# Altium schematic sheet PEG_PCIEX1 SLOT.schdoc
size 420 x 298 mm; Symbol: Sheet-Symbol_A3; Company: 嘉立创EDA; Version: V1.0; Page Size: A3; @Project Name: 【全网首发】X86电脑主板_copy; @Page Count: 17; @Update Date: 2025-10-09; @Create Date: 2025-10-09; @Schematic Name: SCHEMATIC1_1; @Page No: 0; @Page Name: PEG/PCIEX1 SLOT; Device: Sheet-Symbol_A3
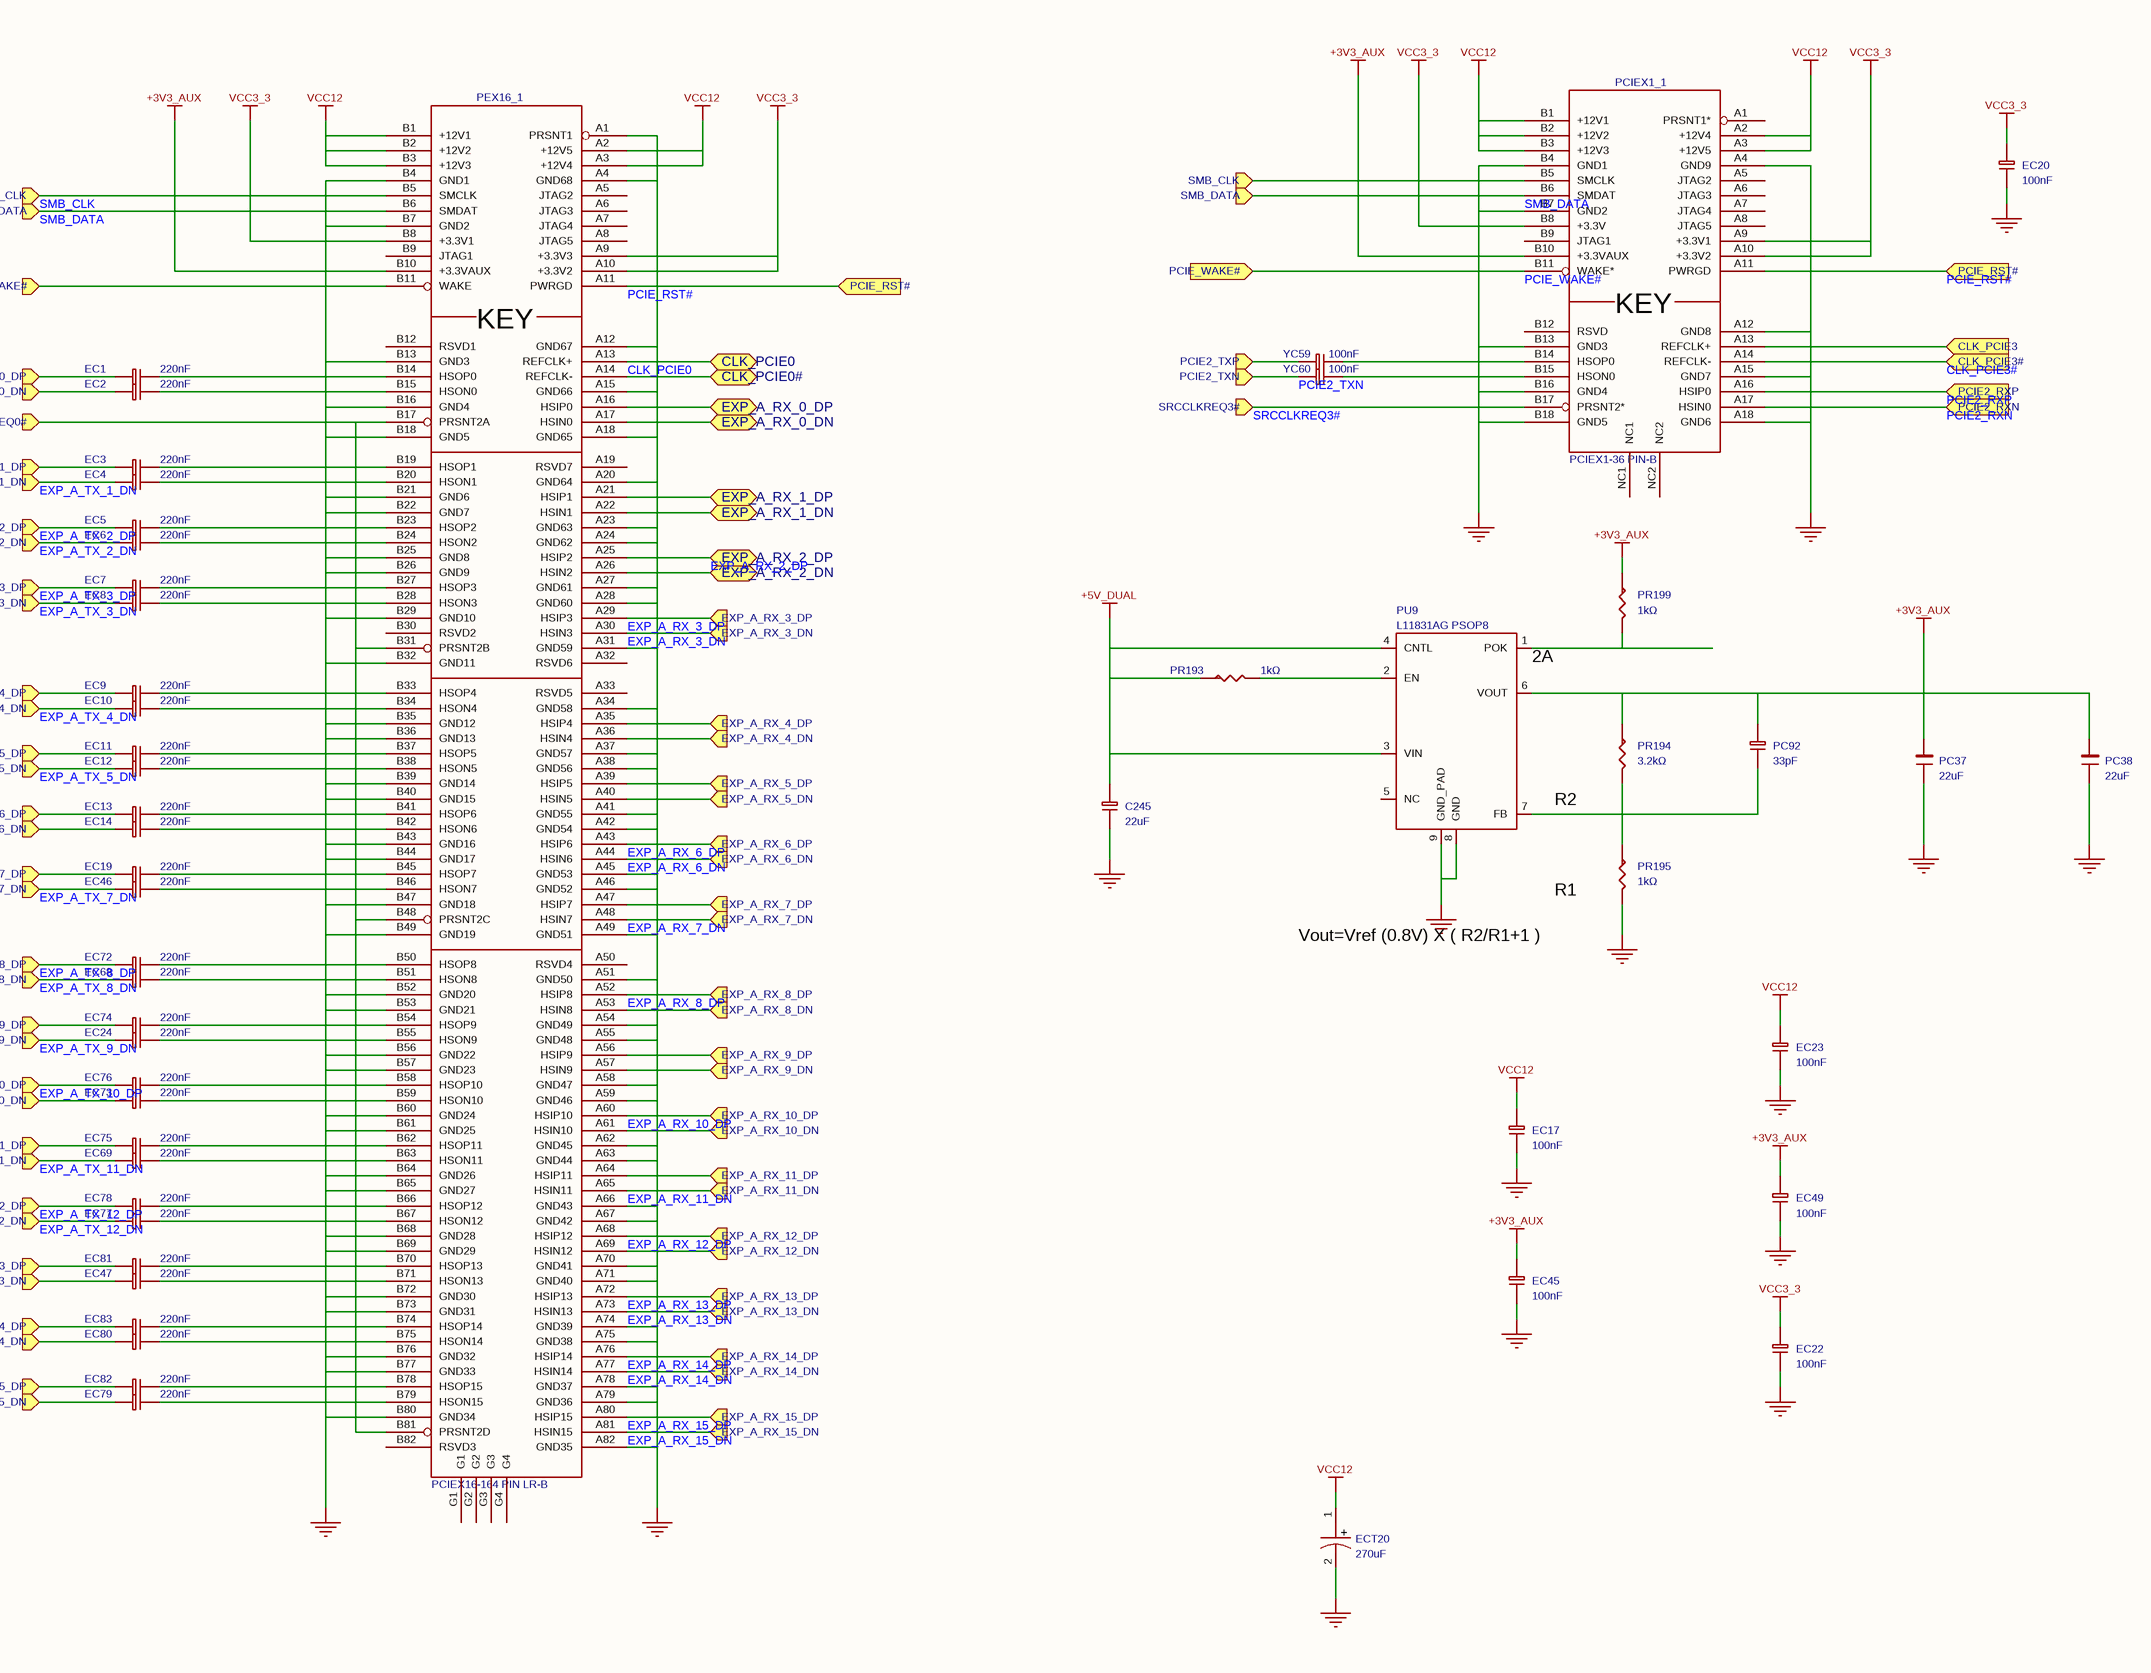
[diagram p0: PEG_PCIEX1 SLOT.schdoc]

## Parts
C245  22uF  [C0603_2]
EC1  220nF  [C0402_1]
EC2  220nF  [C0402_1]
EC3  220nF  [C0402_1]
EC4  220nF  [C0402_1]
EC5  220nF  [C0402_1]
EC6  220nF  [C0402_1]
EC7  220nF  [C0402_1]
EC8  220nF  [C0402_1]
EC9  220nF  [C0402_1]
EC10  220nF  [C0402_1]
EC11  220nF  [C0402_1]
EC12  220nF  [C0402_1]
EC13  220nF  [C0402_1]
EC14  220nF  [C0402_1]
EC17  100nF  [C0402_1]
EC19  220nF  [C0402_1]
EC20  100nF  [C0402_1]
EC22  100nF  [C0402_1]
EC23  100nF  [C0402_3]
EC24  220nF  [C0402_1]
EC45  100nF  [C0402_1]
EC46  220nF  [C0402_1]
EC47  220nF  [C0402_1]
EC49  100nF  [C0402_1]
EC68  220nF  [C0402_1]
EC69  220nF  [C0402_1]
EC72  220nF  [C0402_1]
EC73  220nF  [C0402_1]
EC74  220nF  [C0402_1]
EC75  220nF  [C0402_1]
EC76  220nF  [C0402_1]
EC77  220nF  [C0402_1]
EC78  220nF  [C0402_1]
EC79  220nF  [C0402_1]
EC80  220nF  [C0402_1]
EC81  220nF  [C0402_1]
EC82  220nF  [C0402_1]
EC83  220nF  [C0402_1]
ECT20  270uF  [EC1P25C_2]
PC37  22uF  [C0603_3]
PC38  22uF  [C0603_3]
PC92  33pF  [C0402_3]
PCIEX1_1  value PCIEX1-36 PIN-B  [3GIO_X1-20060619]  (hidden comment: 3183-10200P1T)
PEX16_1  value PCIEX16-164 PIN LR-B  [3GIO_X16_AIR_KORTAK_AKL]  (hidden comment: 2EG78227-D2DL-4F)
PR193  1kΩ  [R0402]
PR194  3.2kΩ  [R0402_3]
PR195  1kΩ  [R0402_2]
PR199  1kΩ  [R0402_2]
PU9  value L11831AG PSOP8  [SO8_50_150GV_2]  (hidden comment: RT9173B_0)
YC59  100nF  [C0402_3]
YC60  100nF  [C0402_3]

## Ports
CLK_PCIE0 (bidir), CLK_PCIE0# (bidir), CLK_PCIE3 (in), CLK_PCIE3# (in), EXP_A_RX_0_DN (bidir), EXP_A_RX_0_DP (bidir), EXP_A_RX_1_DN (bidir), EXP_A_RX_1_DP (bidir), EXP_A_RX_2_DN (bidir), EXP_A_RX_2_DP (bidir), EXP_A_RX_3_DN (in), EXP_A_RX_3_DP (in), EXP_A_RX_4_DN (in), EXP_A_RX_4_DP (in), EXP_A_RX_5_DN (in), EXP_A_RX_5_DP (in), EXP_A_RX_6_DN (in), EXP_A_RX_6_DP (in), EXP_A_RX_7_DN (in), EXP_A_RX_7_DP (in), EXP_A_RX_8_DN (in), EXP_A_RX_8_DP (in), EXP_A_RX_9_DN (in), EXP_A_RX_9_DP (in), EXP_A_RX_10_DN (in), EXP_A_RX_10_DP (in), EXP_A_RX_11_DN (in), EXP_A_RX_11_DP (in), EXP_A_RX_12_DN (in), EXP_A_RX_12_DP (in), EXP_A_RX_13_DN (in), EXP_A_RX_13_DP (in), EXP_A_RX_14_DN (in), EXP_A_RX_14_DP (in), EXP_A_RX_15_DN (in), EXP_A_RX_15_DP (in), EXP_A_TX_0_DN (in), EXP_A_TX_0_DP (in), EXP_A_TX_1_DN (in), EXP_A_TX_1_DP (in), EXP_A_TX_2_DN (in), EXP_A_TX_2_DP (in), EXP_A_TX_3_DN (in), EXP_A_TX_3_DP (in), EXP_A_TX_4_DN (in), EXP_A_TX_4_DP (in), EXP_A_TX_5_DN (in), EXP_A_TX_5_DP (in), EXP_A_TX_6_DN (in), EXP_A_TX_6_DP (in), EXP_A_TX_7_DN (in), EXP_A_TX_7_DP (in), EXP_A_TX_8_DN (in), EXP_A_TX_8_DP (in), EXP_A_TX_9_DN (in), EXP_A_TX_9_DP (in), EXP_A_TX_10_DN (in), EXP_A_TX_10_DP (in), EXP_A_TX_11_DN (in), EXP_A_TX_11_DP (in), EXP_A_TX_12_DN (in), EXP_A_TX_12_DP (in), EXP_A_TX_13_DN (in), EXP_A_TX_13_DP (in), EXP_A_TX_14_DN (in), EXP_A_TX_14_DP (in), EXP_A_TX_15_DN (in), EXP_A_TX_15_DP (in), PCIE2_RXN (in), PCIE2_RXP (in), PCIE2_TXN (in), PCIE2_TXP (in), PCIE_RST# (in), PCIE_WAKE# (in), SMB_CLK (in), SMB_DATA (in), SRCCLKREQ0# (in), SRCCLKREQ3# (in)

## Nets
+3V3_AUX: EC45.1 EC49.1 PC37.1 PC38.1 PC92.2 PCIEX1_1.B10(+3.3VAUX) PEX16_1.B10(+3.3VAUX) PR194.1 PR199.1 PU9.6(VOUT)
+5V_DUAL: C245.1 PR193.1 PU9.3(VIN) PU9.4(CNTL)
GND: C245.2 EC17.2 EC20.2 EC22.2 EC23.2 EC45.2 EC49.2 ECT20.2 PC37.2 PC38.2 PCIEX1_1.A4(GND9) PCIEX1_1.A12(GND8) PCIEX1_1.A15(GND7) PCIEX1_1.A18(GND6) PCIEX1_1.B4(GND1) PCIEX1_1.B7(GND2) PCIEX1_1.B13(GND3) PCIEX1_1.B16(GND4) PCIEX1_1.B18(GND5) PEX16_1.A1(PRSNT1) PEX16_1.A4(GND68) PEX16_1.A12(GND67) PEX16_1.A15(GND66) PEX16_1.A18(GND65) PEX16_1.A20(GND64) PEX16_1.A23(GND63) PEX16_1.A24(GND62) PEX16_1.A27(GND61) PEX16_1.A28(GND60) PEX16_1.A31(GND59) PEX16_1.A34(GND58) PEX16_1.A37(GND57) PEX16_1.A38(GND56) PEX16_1.A41(GND55) PEX16_1.A42(GND54) PEX16_1.A45(GND53) PEX16_1.A46(GND52) PEX16_1.A49(GND51) PEX16_1.A51(GND50) PEX16_1.A54(GND49) PEX16_1.A55(GND48) PEX16_1.A58(GND47) PEX16_1.A59(GND46) PEX16_1.A62(GND45) PEX16_1.A63(GND44) PEX16_1.A66(GND43) PEX16_1.A67(GND42) PEX16_1.A70(GND41) PEX16_1.A71(GND40) PEX16_1.A74(GND39) PEX16_1.A75(GND38) PEX16_1.A78(GND37) PEX16_1.A79(GND36) PEX16_1.A82(GND35) PEX16_1.B4(GND1) PEX16_1.B7(GND2) PEX16_1.B13(GND3) PEX16_1.B16(GND4) PEX16_1.B18(GND5) PEX16_1.B21(GND6) PEX16_1.B22(GND7) PEX16_1.B25(GND8) PEX16_1.B26(GND9) PEX16_1.B29(GND10) PEX16_1.B32(GND11) PEX16_1.B35(GND12) PEX16_1.B36(GND13) PEX16_1.B39(GND14) PEX16_1.B40(GND15) PEX16_1.B43(GND16) PEX16_1.B44(GND17) PEX16_1.B47(GND18) PEX16_1.B49(GND19) PEX16_1.B52(GND20) PEX16_1.B53(GND21) PEX16_1.B56(GND22) PEX16_1.B57(GND23) PEX16_1.B60(GND24) PEX16_1.B61(GND25) PEX16_1.B64(GND26) PEX16_1.B65(GND27) PEX16_1.B68(GND28) PEX16_1.B69(GND29) PEX16_1.B72(GND30) PEX16_1.B73(GND31) PEX16_1.B76(GND32) PEX16_1.B77(GND33) PEX16_1.B80(GND34) PR195.2 PU9.8(GND) PU9.9(GND_PAD)
VCC3_3: EC20.1 EC22.1 PCIEX1_1.A9(+3.3V1) PCIEX1_1.A10(+3.3V2) PCIEX1_1.B8(+3.3V) PEX16_1.A9(+3.3V3) PEX16_1.A10(+3.3V2) PEX16_1.B8(+3.3V1)
VCC12: EC17.1 EC23.1 ECT20.1 PCIEX1_1.A2(+12V4) PCIEX1_1.A3(+12V5) PCIEX1_1.B1(+12V1) PCIEX1_1.B2(+12V2) PCIEX1_1.B3(+12V3) PEX16_1.A2(+12V5) PEX16_1.A3(+12V4) PEX16_1.B1(+12V1) PEX16_1.B2(+12V2) PEX16_1.B3(+12V3)
CLK_PCIE0: PEX16_1.A13(REFCLK+) ; port CLK_PCIE0
CLK_PCIE0#: PEX16_1.A14(REFCLK-) ; port CLK_PCIE0#
CLK_PCIE3: PCIEX1_1.A13(REFCLK+) ; port CLK_PCIE3
CLK_PCIE3#: PCIEX1_1.A14(REFCLK-) ; port CLK_PCIE3#
EXP_A_RX_0_DN: PEX16_1.A17(HSIN0) ; port EXP_A_RX_0_DN
EXP_A_RX_0_DP: PEX16_1.A16(HSIP0) ; port EXP_A_RX_0_DP
EXP_A_RX_1_DN: PEX16_1.A22(HSIN1) ; port EXP_A_RX_1_DN
EXP_A_RX_1_DP: PEX16_1.A21(HSIP1) ; port EXP_A_RX_1_DP
EXP_A_RX_2_DN: PEX16_1.A26(HSIN2) ; port EXP_A_RX_2_DN
EXP_A_RX_2_DP: PEX16_1.A25(HSIP2) ; port EXP_A_RX_2_DP
EXP_A_RX_3_DN: PEX16_1.A30(HSIN3) ; port EXP_A_RX_3_DN
EXP_A_RX_3_DP: PEX16_1.A29(HSIP3) ; port EXP_A_RX_3_DP
EXP_A_RX_4_DN: PEX16_1.A36(HSIN4) ; port EXP_A_RX_4_DN
EXP_A_RX_4_DP: PEX16_1.A35(HSIP4) ; port EXP_A_RX_4_DP
EXP_A_RX_5_DN: PEX16_1.A40(HSIN5) ; port EXP_A_RX_5_DN
EXP_A_RX_5_DP: PEX16_1.A39(HSIP5) ; port EXP_A_RX_5_DP
EXP_A_RX_6_DN: PEX16_1.A44(HSIN6) ; port EXP_A_RX_6_DN
EXP_A_RX_6_DP: PEX16_1.A43(HSIP6) ; port EXP_A_RX_6_DP
EXP_A_RX_7_DN: PEX16_1.A48(HSIN7) ; port EXP_A_RX_7_DN
EXP_A_RX_7_DP: PEX16_1.A47(HSIP7) ; port EXP_A_RX_7_DP
EXP_A_RX_8_DN: PEX16_1.A53(HSIN8) ; port EXP_A_RX_8_DN
EXP_A_RX_8_DP: PEX16_1.A52(HSIP8) ; port EXP_A_RX_8_DP
EXP_A_RX_9_DN: PEX16_1.A57(HSIN9) ; port EXP_A_RX_9_DN
EXP_A_RX_9_DP: PEX16_1.A56(HSIP9) ; port EXP_A_RX_9_DP
EXP_A_RX_10_DN: PEX16_1.A61(HSIN10) ; port EXP_A_RX_10_DN
EXP_A_RX_10_DP: PEX16_1.A60(HSIP10) ; port EXP_A_RX_10_DP
EXP_A_RX_11_DN: PEX16_1.A65(HSIN11) ; port EXP_A_RX_11_DN
EXP_A_RX_11_DP: PEX16_1.A64(HSIP11) ; port EXP_A_RX_11_DP
EXP_A_RX_12_DN: PEX16_1.A69(HSIN12) ; port EXP_A_RX_12_DN
EXP_A_RX_12_DP: PEX16_1.A68(HSIP12) ; port EXP_A_RX_12_DP
EXP_A_RX_13_DN: PEX16_1.A73(HSIN13) ; port EXP_A_RX_13_DN
EXP_A_RX_13_DP: PEX16_1.A72(HSIP13) ; port EXP_A_RX_13_DP
EXP_A_RX_14_DN: PEX16_1.A77(HSIN14) ; port EXP_A_RX_14_DN
EXP_A_RX_14_DP: PEX16_1.A76(HSIP14) ; port EXP_A_RX_14_DP
EXP_A_RX_15_DN: PEX16_1.A81(HSIN15) ; port EXP_A_RX_15_DN
EXP_A_RX_15_DP: PEX16_1.A80(HSIP15) ; port EXP_A_RX_15_DP
EXP_A_TX_0_DN: EC2.1 ; port EXP_A_TX_0_DN
EXP_A_TX_0_DP: EC1.1 ; port EXP_A_TX_0_DP
EXP_A_TX_1_DN: EC4.1 ; port EXP_A_TX_1_DN
EXP_A_TX_1_DP: EC3.1 ; port EXP_A_TX_1_DP
EXP_A_TX_2_DN: EC6.1 ; port EXP_A_TX_2_DN
EXP_A_TX_2_DP: EC5.1 ; port EXP_A_TX_2_DP
EXP_A_TX_3_DN: EC8.1 ; port EXP_A_TX_3_DN
EXP_A_TX_3_DP: EC7.1 ; port EXP_A_TX_3_DP
EXP_A_TX_4_DN: EC10.1 ; port EXP_A_TX_4_DN
EXP_A_TX_4_DP: EC9.1 ; port EXP_A_TX_4_DP
EXP_A_TX_5_DN: EC12.1 ; port EXP_A_TX_5_DN
EXP_A_TX_5_DP: EC11.1 ; port EXP_A_TX_5_DP
EXP_A_TX_6_DN: EC14.1 ; port EXP_A_TX_6_DN
EXP_A_TX_6_DP: EC13.1 ; port EXP_A_TX_6_DP
EXP_A_TX_7_DN: EC46.1 ; port EXP_A_TX_7_DN
EXP_A_TX_7_DP: EC19.1 ; port EXP_A_TX_7_DP
EXP_A_TX_8_DN: EC68.1 ; port EXP_A_TX_8_DN
EXP_A_TX_8_DP: EC72.1 ; port EXP_A_TX_8_DP
EXP_A_TX_9_DN: EC24.1 ; port EXP_A_TX_9_DN
EXP_A_TX_9_DP: EC74.1 ; port EXP_A_TX_9_DP
EXP_A_TX_10_DN: EC73.1 ; port EXP_A_TX_10_DN
EXP_A_TX_10_DP: EC76.1 ; port EXP_A_TX_10_DP
EXP_A_TX_11_DN: EC69.1 ; port EXP_A_TX_11_DN
EXP_A_TX_11_DP: EC75.1 ; port EXP_A_TX_11_DP
EXP_A_TX_12_DN: EC77.1 ; port EXP_A_TX_12_DN
EXP_A_TX_12_DP: EC78.1 ; port EXP_A_TX_12_DP
EXP_A_TX_13_DN: EC47.1 ; port EXP_A_TX_13_DN
EXP_A_TX_13_DP: EC81.1 ; port EXP_A_TX_13_DP
EXP_A_TX_14_DN: EC80.1 ; port EXP_A_TX_14_DN
EXP_A_TX_14_DP: EC83.1 ; port EXP_A_TX_14_DP
EXP_A_TX_15_DN: EC79.1 ; port EXP_A_TX_15_DN
EXP_A_TX_15_DP: EC82.1 ; port EXP_A_TX_15_DP
PCIE2_RXN: PCIEX1_1.A17(HSIN0) ; port PCIE2_RXN
PCIE2_RXP: PCIEX1_1.A16(HSIP0) ; port PCIE2_RXP
PCIE2_TXN: YC60.1 ; port PCIE2_TXN
PCIE2_TXP: YC59.1 ; port PCIE2_TXP
PCIE_RST#: PCIEX1_1.A11(PWRGD) PEX16_1.A11(PWRGD) ; port PCIE_RST#
PCIE_WAKE#: PCIEX1_1.B11(WAKE*) PEX16_1.B11(WAKE) ; port PCIE_WAKE#
SMB_CLK: PCIEX1_1.B5(SMCLK) PEX16_1.B5(SMCLK) ; port SMB_CLK
SMB_DATA: PCIEX1_1.B6(SMDAT) PEX16_1.B6(SMDAT) ; port SMB_DATA
SRCCLKREQ0#: PEX16_1.B17(PRSNT2A) PEX16_1.B31(PRSNT2B) PEX16_1.B48(PRSNT2C) PEX16_1.B81(PRSNT2D) ; port SRCCLKREQ0#
SRCCLKREQ3#: PCIEX1_1.B17(PRSNT2*) ; port SRCCLKREQ3#
NetEC1_2: EC1.2 PEX16_1.B14(HSOP0)
NetEC2_2: EC2.2 PEX16_1.B15(HSON0)
NetEC3_2: EC3.2 PEX16_1.B19(HSOP1)
NetEC4_2: EC4.2 PEX16_1.B20(HSON1)
NetEC5_2: EC5.2 PEX16_1.B23(HSOP2)
NetEC6_2: EC6.2 PEX16_1.B24(HSON2)
NetEC7_2: EC7.2 PEX16_1.B27(HSOP3)
NetEC8_2: EC8.2 PEX16_1.B28(HSON3)
NetEC9_2: EC9.2 PEX16_1.B33(HSOP4)
NetEC10_2: EC10.2 PEX16_1.B34(HSON4)
NetEC11_2: EC11.2 PEX16_1.B37(HSOP5)
NetEC12_2: EC12.2 PEX16_1.B38(HSON5)
NetEC13_2: EC13.2 PEX16_1.B41(HSOP6)
NetEC14_2: EC14.2 PEX16_1.B42(HSON6)
NetEC19_2: EC19.2 PEX16_1.B45(HSOP7)
NetEC24_2: EC24.2 PEX16_1.B55(HSON9)
NetEC46_2: EC46.2 PEX16_1.B46(HSON7)
NetEC47_2: EC47.2 PEX16_1.B71(HSON13)
NetEC68_2: EC68.2 PEX16_1.B51(HSON8)
NetEC69_2: EC69.2 PEX16_1.B63(HSON11)
NetEC72_2: EC72.2 PEX16_1.B50(HSOP8)
NetEC73_2: EC73.2 PEX16_1.B59(HSON10)
NetEC74_2: EC74.2 PEX16_1.B54(HSOP9)
NetEC75_2: EC75.2 PEX16_1.B62(HSOP11)
NetEC76_2: EC76.2 PEX16_1.B58(HSOP10)
NetEC77_2: EC77.2 PEX16_1.B67(HSON12)
NetEC78_2: EC78.2 PEX16_1.B66(HSOP12)
NetEC79_2: EC79.2 PEX16_1.B79(HSON15)
NetEC80_2: EC80.2 PEX16_1.B75(HSON14)
NetEC81_2: EC81.2 PEX16_1.B70(HSOP13)
NetEC82_2: EC82.2 PEX16_1.B78(HSOP15)
NetEC83_2: EC83.2 PEX16_1.B74(HSOP14)
NetPC92_1: PC92.1 PR194.2 PR195.1 PU9.7(FB)
NetPCIEX1_1_B14: PCIEX1_1.B14(HSOP0) YC59.2
NetPCIEX1_1_B15: PCIEX1_1.B15(HSON0) YC60.2
NetPR193_2: PR193.2 PU9.2(EN)
NetPR199_2: PR199.2 PU9.1(POK)

Not connected (* = marked no-connect by the designer): PCIEX1_1 A1(PRSNT1*) A5(JTAG2) A6(JTAG3) A7(JTAG4) A8(JTAG5) B9(JTAG1) B12(RSVD) NC1 NC2; PEX16_1 A5(JTAG2) A6(JTAG3) A7(JTAG4) A8(JTAG5) A19(RSVD7) A32(RSVD6) A33(RSVD5) A50(RSVD4) B9(JTAG1) B12(RSVD1) B30(RSVD2) B82(RSVD3) G1 G2 G3 G4; PU9 5(NC)

## Notes on the sheet
- (near PU9) 2A
- R2
- Vout=Vref (0.8V) X ( R2/R1+1 )
- R1
- 更新日期
- 2025-10-09
- 原理图
- 图页
- SCHEMATIC1_1
- PEG/PCIEX1 SLOT
- 创建日期
- 物料编码
- 审阅
- 绘制
- 【全网首发】X86电脑主板_copy
- 版本
- V1.0
- 尺寸
- A3
- 页
- 0
- 嘉立创EDA
- 共
- 17
- (in symbol 2EG78227-D2DL-4F) KEY
- (in symbol 160AREC271M0609) +
- (in symbol 3183-10200P1T) KEY

## Library data of the parts
C245 = CL10A226MQ8NRNC_1: 容值:22uF;精度:±20%;额定电压:6.3V;材质(温度系数):X5R;; Manufacturer: SAMSUNG(三星); 3D Model: ac125912035d415993ca9572d50418b1; Symbol: CAP; PCB Footprint: C0603; Tolerance: ±20%; AddInBom: yes; Voltage Rated: 6.3V; ModelName: C0603_L1.6-W0.8-H0.8; ModelTransform: 62.992,31.496,0,0,0,0,0,0,0; Temperature Coefficient: X5R; Device: CL10A226MQ8NRNC_1; Value: 22uF; Supplier: LCSC; Datasheet: https://atta.szlcsc.com/upload/public/pdf/source/20160103/1457707740762.pdf; FootprintName: C0603_2; SupplierPart: C59461; ConvertToPcb: yes; LCSC Part Name: 22uF ±20% 6.3V; JLCPCB Part Class: Basic Part; ManufacturerPart: CL10A226MQ8NRNC; Supplier Footprint: 0603
EC1-EC14 EC19 EC46 = CL05B224KO5NNNC: 容值:220nF;精度:±10%;额定电压:16V;材质(温度系数):X7R;; Manufacturer: SAMSUNG(三星); Symbol: CAP; PCB Footprint: C0402; Tolerance: ±10%; ModelId: 36a51122f27c49738f86b3bfa98863e0; AddInBom: yes; Voltage Rated: 16V; ModelName: C0402_L1.0-W0.5-H0.5; ModelTransform: 39.37,19.685,0,0,0,0,0,0,0; Temperature Coefficient: X7R; Device: CL05B224KO5NNNC; Value: 220nF; Supplier: LCSC; Datasheet: https://atta.szlcsc.com/upload/public/pdf/source/20160103/1457707689724.pdf; FootprintName: C0402_1; SupplierPart: C16772; ConvertToPcb: yes; LCSC Part Name: 220nF ±10% 16V; JLCPCB Part Class: Basic Part; ManufacturerPart: CL05B224KO5NNNC; Supplier Footprint: 0402
EC17 EC20 EC22 EC23 EC45 EC49 YC59 YC60 = CL05B104KO5NNNC: 容值:100nF;精度:±10%;额定电压:16V;材质(温度系数):X7R;; Manufacturer: SAMSUNG(三星); Symbol: CAP; PCB Footprint: C0402; Tolerance: ±10%; ModelId: 36a51122f27c49738f86b3bfa98863e0; AddInBom: yes; Voltage Rated: 16V; ModelName: C0402_L1.0-W0.5-H0.5; ModelTransform: 39.37,19.685,0,0,0,0,0,0,0; Temperature Coefficient: X7R; Device: CL05B104KO5NNNC; Value: 100nF; Supplier: LCSC; Datasheet: https://atta.szlcsc.com/upload/public/pdf/source/20160103/1457707674891.pdf; SupplierPart: C1525; ConvertToPcb: yes; LCSC Part Name: 100nF ±10% 16V; JLCPCB Part Class: Basic Part; ManufacturerPart: CL05B104KO5NNNC; Supplier Footprint: 0402
  EC17 EC20 EC22 EC45 EC49: FootprintName: C0402_1
  EC23 YC59 YC60: FootprintName: C0402_3
EC24 EC47 EC68 EC69 EC72-EC83 = CL05B224KO5NNNC: 容值:220nF;精度:±10%;额定电压:16V;材质(温度系数):X7R;; Manufacturer: SAMSUNG(三星); Symbol: CAP_3; ModelId: 36a51122f27c49738f86b3bfa98863e0; Tolerance: ±10%; AddInBom: yes; Voltage Rated: 16V; ModelName: C0402_L1.0-W0.5-H0.5; ModelTransform: 39.37,19.685,0,0,0,0,0,0,0; Temperature Coefficient: X7R; Device: CL05B224KO5NNNC; Value: 220nF; Supplier: LCSC; Datasheet: https://atta.szlcsc.com/upload/public/pdf/source/20160103/1457707689724.pdf; FootprintName: C0402_1; SupplierPart: C16772; ConvertToPcb: yes; LCSC Part Name: 220nF ±10% 16V; JLCPCB Part Class: Basic Part; ManufacturerPart: CL05B224KO5NNNC; Supplier Footprint: 0402
ECT20 = 160AREC271M0609: 容值:270uF;精度:±20%;额定电压:16V;纹波电流:3.8A@100kHz;等效串联电阻:15mΩ@100kHz~300kHz;类型:-;; Manufacturer: APAQ(钰邦); Symbol: CAPACITOR POL_0; AddInBom: yes; ModelId: 0a4db4bf24b443b3be4905be97ff10c5; ModelName: CAP-TH_BD6.3-P2.50-D1.0-FD; ModelTransform: 248.4247,247.99777,0,0,0,0,0,0,-137.795; Tolerance: ±20%; Rated Voltage: 16V; φD: 6.3mm; L: 9mm; Lifetime @ Temp: 2000hrs@105℃; Device: 160AREC271M0609; Value: 270uF; LCSC Part Name: 270uF ±20% 16V; SupplierPart: C176312; ManufacturerPart: 160AREC271M0609; Supplier Footprint: 插件,D6.3xL9mm; JLCPCB Part Class: Extended Part; Datasheet: https://atta.szlcsc.com/upload/public/pdf/source/20180420/C176312_A6CC051F3F5535015096354530D22B11.pdf; Supplier: LCSC; ConvertToPcb: yes; FootprintName: EC1P25C_2; Ripple Current: 3.8A@100kHz; Equivalent Series Resistance(ESR): 15mΩ@100kHz~300kHz; Type: -; Lead Spacing: 2.5mm; Operating Temperature: -55℃~+105℃
PC37 PC38 = CL10A226MQ8NRNC: 容值:22uF;精度:±20%;额定电压:6.3V;材质(温度系数):X5R;; Manufacturer: SAMSUNG(三星); Symbol: C0805; AddInBom: yes; Tolerance: ±20%; Voltage Rated: 6.3V; Temperature Coefficient: X5R; ModelId: ac125912035d415993ca9572d50418b1; ModelName: C0603_L1.6-W0.8-H0.8; ModelTransform: 62.992,31.496,0,0,0,0,0,0,0; Device: CL10A226MQ8NRNC; Value: 22uF; LCSC Part Name: 22uF ±20% 6.3V; SupplierPart: C59461; ManufacturerPart: CL10A226MQ8NRNC; Supplier Footprint: 0603; JLCPCB Part Class: Basic Part; Datasheet: https://atta.szlcsc.com/upload/public/pdf/source/20160218/1457707763339.pdf; Supplier: LCSC; ConvertToPcb: yes; FootprintName: C0603_3
PC92 = CC0402JRNPO9BN330: 容值:33pF;精度:±5%;额定电压:50V;材质(温度系数):NP0;; Manufacturer: YAGEO(国巨); Symbol: C-0603_3; ModelId: 36a51122f27c49738f86b3bfa98863e0; Tolerance: ±5%; AddInBom: yes; Voltage Rated: 50V; ModelName: C0402_L1.0-W0.5-H0.5; ModelTransform: 39.37,19.685,0,0,0,0,0,0,0; Temperature Coefficient: NP0; Device: CC0402JRNPO9BN330; Value: 33pF; Supplier: LCSC; Datasheet: https://atta.szlcsc.com/upload/public/pdf/source/20171026/C107005_15089856307561059550.pdf; FootprintName: C0402_3; SupplierPart: C107005; ConvertToPcb: yes; LCSC Part Name: 33pF ±5% 50V; JLCPCB Part Class: Extended Part; ManufacturerPart: CC0402JRNPO9BN330; Supplier Footprint: 0402
PCIEX1_1 = 3183-10200P1T: 连接器类型:PCI-E;间距:1mm;引脚总数:36P;安装方式:直插;工作温度范围:-;; Manufacturer: UMaxconn; Symbol: 3GPIOX1_1; Pitch: 1mm; ModelId: 31107a67ea9241f2923ada2e205807af; AddInBom: yes; ModelName: CONN-TH_36P-P1.00-V_3183-XXXXXPXT; Connector Type: PCI-E; ModelTransform: 984.25,346.456,0,0,0,0,0,-25.591,-177.165; Device: 3183-10200P1T; Supplier: LCSC; Datasheet: https://atta.szlcsc.com/upload/public/pdf/source/20221109/DBCA7DEED61952BFBF0AC75AC3B44CB1.pdf; FootprintName: 3GIO_X1-20060619; SupplierPart: C404113; ConvertToPcb: yes; LCSC Part Name: PCI-E 1mm P数:36P 镀金G/F 黑色; Mounting Style: 直插; Number of Pins: 36P; JLCPCB Part Class: Extended Part; ManufacturerPart: 3183-10200P1T; Height Above Board: 11.25mm; Supplier Footprint: 插件,P=1mm; Operating Temperature Range: -
PEX16_1 = 2EG78227-D2DL-4F: 连接器类型:PCI-E;间距:1mm;引脚总数:164P;安装方式:直插;工作温度范围:-40℃~+105℃;; Manufacturer: FOXCONN(富士康); Symbol: 3GPIOX16_1; AddInBom: yes; ModelId: dfc542c144e148ca86ecc4ff4264af27; ModelName: PCIE-TH_2EG78227-D2DL-4F; ModelTransform: 4153.535,530.9,0,0,0,0,324.802,62.992,-177.165; Connector Type: PCI-E; Pitch: 1mm; Device: 2EG78227-D2DL-4F; LCSC Part Name: 1mm P数:164P; SupplierPart: C2839835; ManufacturerPart: 2EG78227-D2DL-4F; Supplier Footprint: 插件,P=1mm; JLCPCB Part Class: Extended Part; Datasheet: https://atta.szlcsc.com/upload/public/pdf/source/20210616/C2839835_C40EC9904ACFAD2927B1FE81A9713DE3.pdf; Supplier: LCSC; ConvertToPcb: yes; FootprintName: 3GIO_X16_AIR_KORTAK_AKL; Number of Pins: 164P; Mounting Style: 直插; Height Above Board: 11mm; Operating Temperature Range: -40℃~+105℃
PR193 = 0402WGF1001TCE: 电阻类型:厚膜电阻;阻值:1kΩ;精度:±1%;功率:62.5mW;; Manufacturer: UNI-ROYAL(厚声); Symbol: R-0603_0; ModelId: 671aefced39d4c318694bba8bd8efd39; Tolerance: ±1%; AddInBom: yes; Power(Watts): 62.5mW; ModelName: R0402_L1.0-W0.5-H0.5; ModelTransform: 39.37,19.685,0,0,0,0,0,0.0005,0; Overload Voltage (Max): 50V; Temperature Coefficient: ±100ppm/℃; Device: 0402WGF1001TCE; Value: 1kΩ; Type: 厚膜电阻; Supplier: LCSC; Datasheet: https://atta.szlcsc.com/upload/public/pdf/source/20200306/C422600_1E6D84923E4A46A82E41ADD87F860B5C.pdf; FootprintName: R0402; SupplierPart: C11702; ConvertToPcb: yes; LCSC Part Name: 1kΩ ±1% 62.5mW; JLCPCB Part Class: Basic Part; ManufacturerPart: 0402WGF1001TCE; Supplier Footprint: 0402; Operating Temperature Range: -55℃~+155℃
PR194 = RT0402BRD073K2L: 电阻类型:薄膜电阻;阻值:3.2kΩ;精度:±0.1%;功率:62.5mW;最大工作电压:50V;温度系数:±25ppm/℃;; Manufacturer: YAGEO(国巨); Symbol: R-0603; AddInBom: yes; ModelId: 671aefced39d4c318694bba8bd8efd39; ModelName: R0402_L1.0-W0.5-H0.5; ModelTransform: 39.37,19.685,0,0,0,0,0,0.0005,0; Tolerance: ±0.1%; Power(Watts): 62.5mW; Overload Voltage (Max): 50V; Device: RT0402BRD073K2L; Value: 3.2kΩ; LCSC Part Name: 薄膜电阻 3.2kΩ ±0.1% 62.5mW; SupplierPart: C705066; ManufacturerPart: RT0402BRD073K2L; Supplier Footprint: 0402; JLCPCB Part Class: Extended Part; Datasheet: https://atta.szlcsc.com/upload/public/pdf/source/20200720/C705066_AC9A8CDCFD7D351B8891536FAAAB5B91.pdf; Supplier: LCSC; ConvertToPcb: yes; FootprintName: R0402_3; Type: 薄膜电阻; Temperature Coefficient: ±25ppm/℃; Operating Temperature Range: -55℃~+155℃
PR195 PR199 = 0402WGF1001TCE: 电阻类型:厚膜电阻;阻值:1kΩ;精度:±1%;功率:62.5mW;; Manufacturer: UNI-ROYAL(厚声); Symbol: R-0603; ModelId: 671aefced39d4c318694bba8bd8efd39; Tolerance: ±1%; AddInBom: yes; Power(Watts): 62.5mW; ModelName: R0402_L1.0-W0.5-H0.5; ModelTransform: 39.37,19.685,0,0,0,0,0,0.0005,0; Overload Voltage (Max): 50V; Temperature Coefficient: ±100ppm/℃; Device: 0402WGF1001TCE; Value: 1kΩ; Type: 厚膜电阻; Supplier: LCSC; Datasheet: https://atta.szlcsc.com/upload/public/pdf/source/20200306/C422600_1E6D84923E4A46A82E41ADD87F860B5C.pdf; FootprintName: R0402_2; SupplierPart: C11702; ConvertToPcb: yes; LCSC Part Name: 1kΩ ±1% 62.5mW; JLCPCB Part Class: Basic Part; ManufacturerPart: 0402WGF1001TCE; Supplier Footprint: 0402; Operating Temperature Range: -55℃~+155℃
PU9 = RT9173B_3: Check: false; AddInBom: yes; Device: RT9173B_3; Symbol: RT9173B_0; FootprintName: SO8_50_150GV_2; ConvertToPcb: yes